# EasyEDA Pro project 嘉立创工程文件.epro

# Schematic Schematic1
Assembly Variant: Basic; Board Name: Board1; Create Date: 2026-05-23; Page Name: P1; Project Name: 温度检测扩展板; Schematic Name: Schematic1; Update Date: 2026-05-23; Company: 嘉立创EDA; Page Size: A4; Version: V1.0
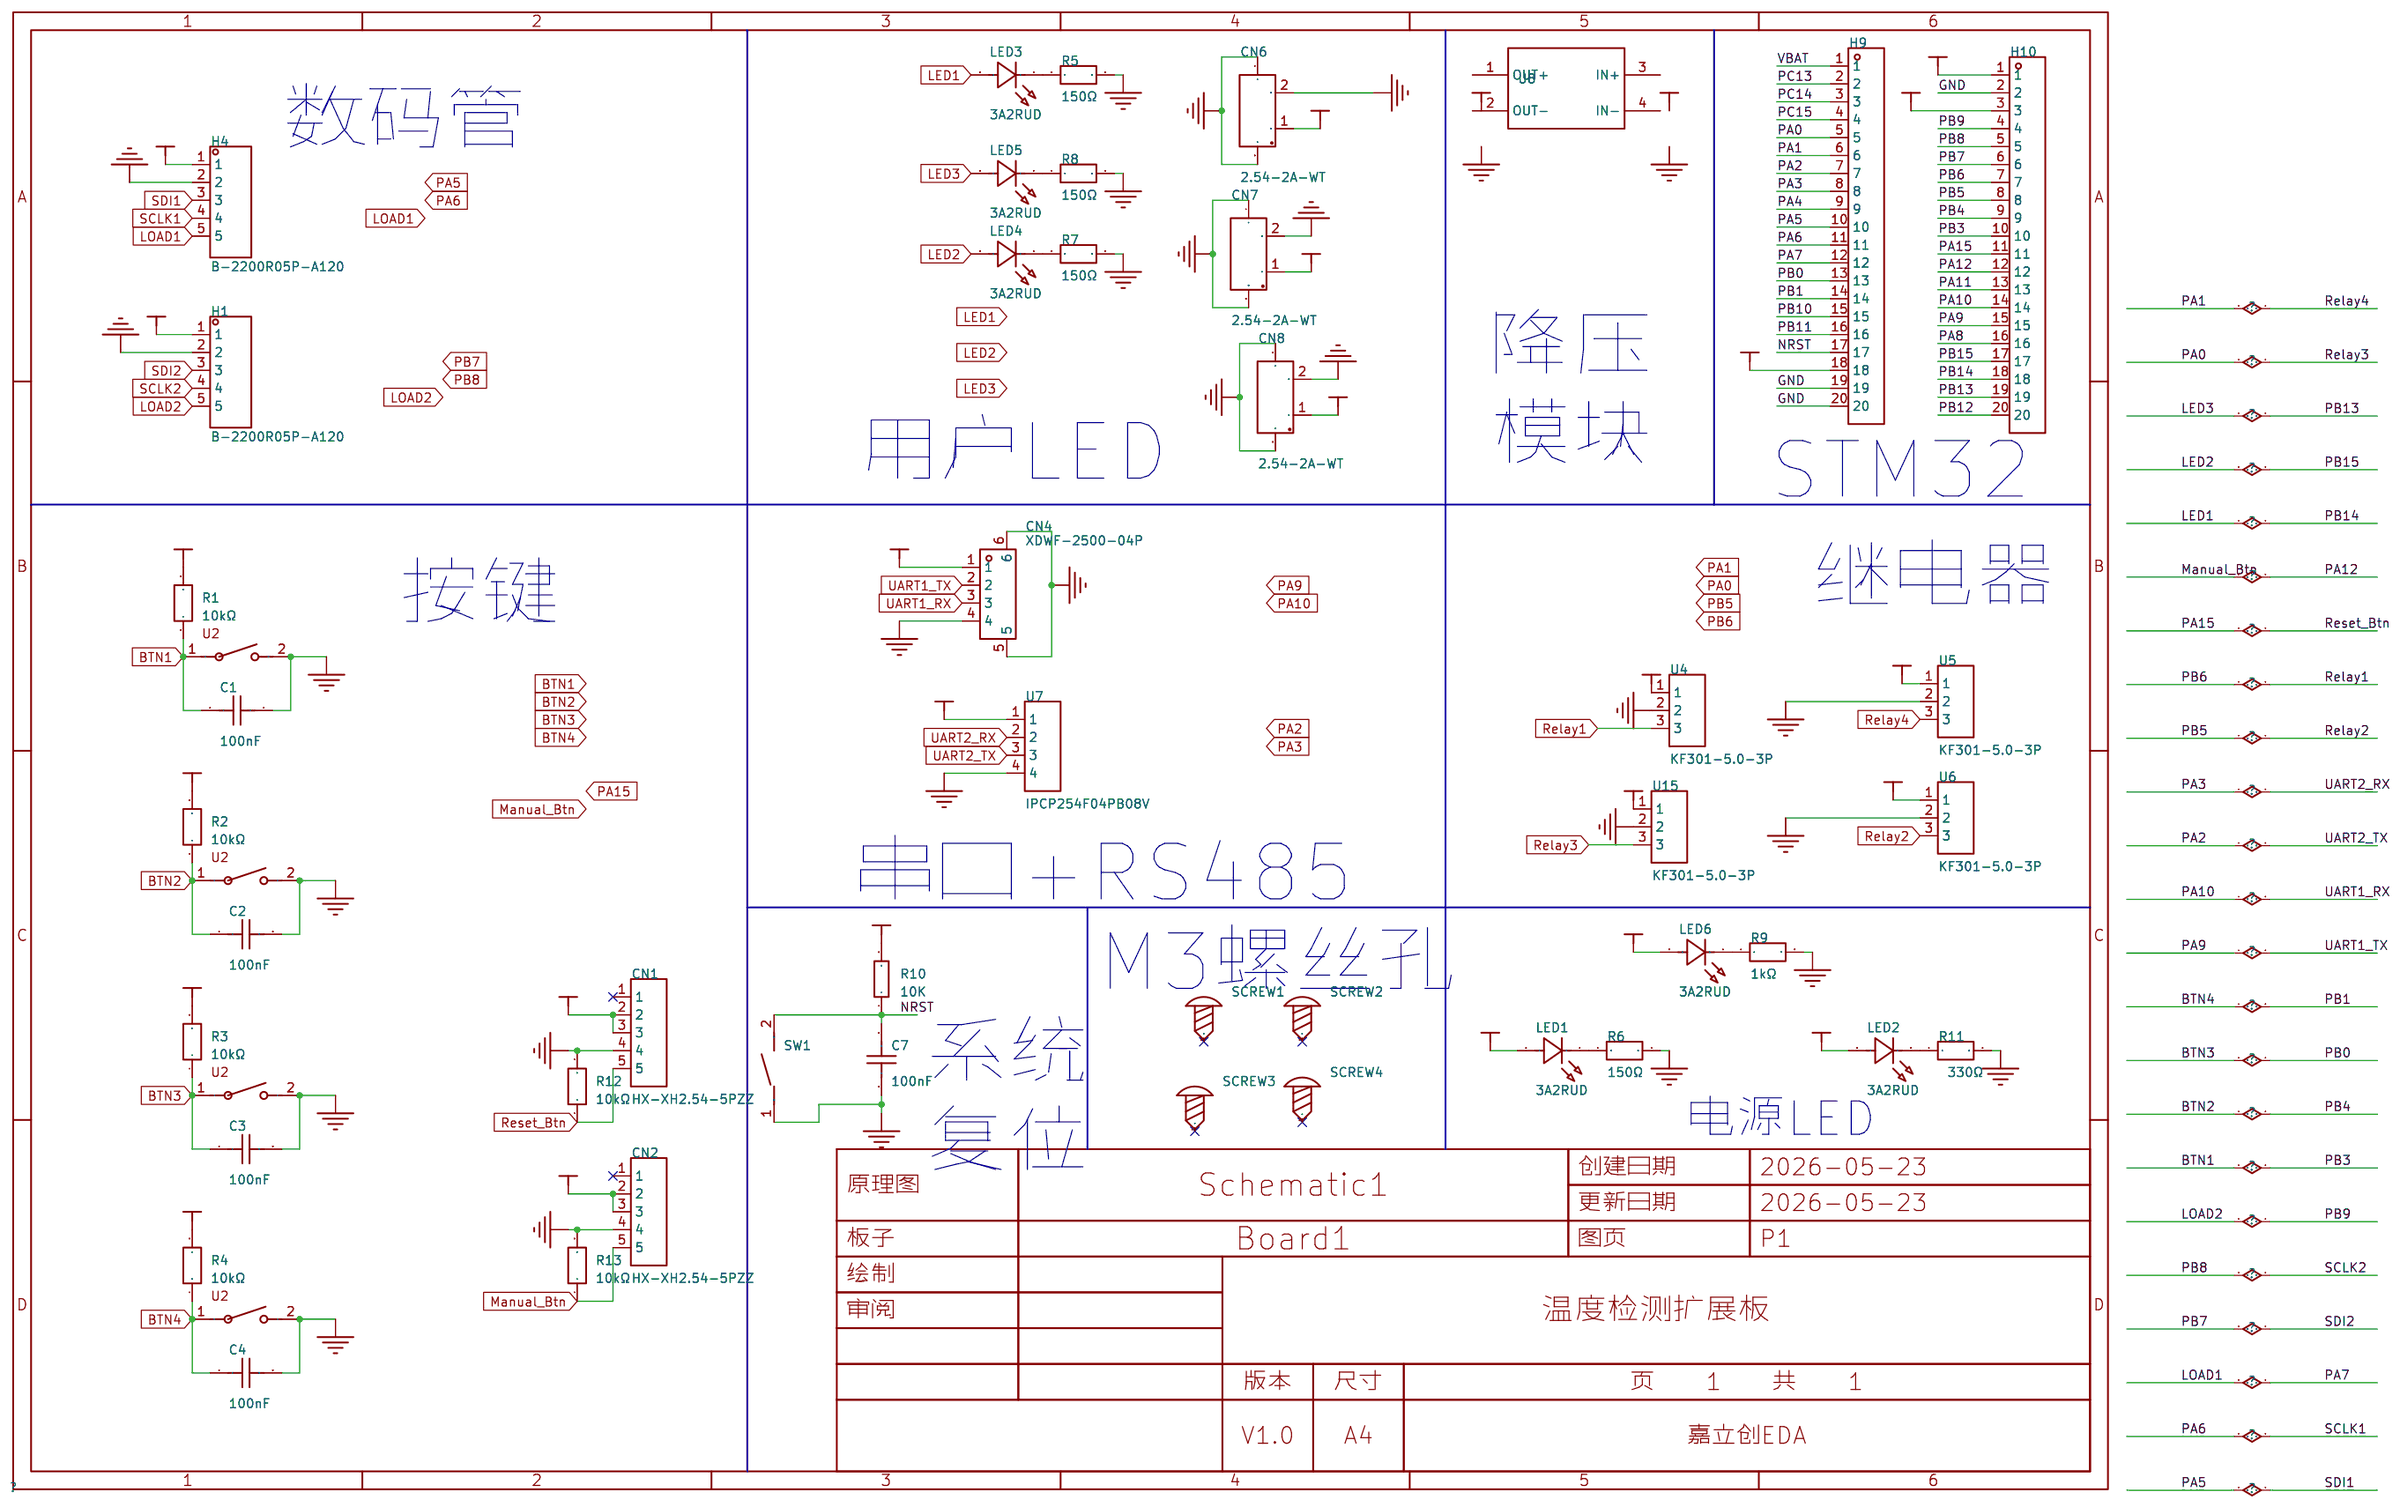
[diagram p0: schematic sheet]

## Parts
C1  100nF  [C0603]
C2  100nF  [C0603]
C3  100nF  [C0603]
C4  100nF  [C0603]
C7  100nF  [C0603]
CN1  HX-XH2.54-5PZZ  [CONN-TH_5P-P2.50_ZX-XH2.54-5PZZ]
CN2  HX-XH2.54-5PZZ  [CONN-TH_5P-P2.50_ZX-XH2.54-5PZZ]
CN4  XDWF-2500-04P  [CONN-SMD_4P-P2.54_MXXH-2.54-04P-WT1-0-A]
CN6  2.54-2A-WT  [CONN-SMD_2.54-2A-WT]
CN7  2.54-2A-WT  [CONN-SMD_2.54-2A-WT]
CN8  2.54-2A-WT  [CONN-SMD_2.54-2A-WT]
H1  B-2200R05P-A120  [HDR-TH_5P-P2.54_220R-1-5P]
H4  B-2200R05P-A120  [HDR-TH_5P-P2.54_220R-1-5P]
H9  22850120ANG1SYA01  [HDR-TH_20P-P2.54-V-F]
H10  22850120ANG1SYA01  [HDR-TH_20P-P2.54-V-F]
LED1  3A2RUD  [LED-TH_BD3.5-P2.28_3A2RUC]
LED2  3A2RUD  [LED-TH_BD3.5-P2.28_3A2RUC]
LED3  3A2RUD  [LED-TH_BD3.5-P2.28_3A2RUC]
LED4  3A2RUD  [LED-TH_BD3.5-P2.28_3A2RUC]
LED5  3A2RUD  [LED-TH_BD3.5-P2.28_3A2RUC]
LED6  3A2RUD  [LED-TH_BD3.5-P2.28_3A2RUC]
R1  10kΩ  [R0603]
R2  10kΩ  [R0603]
R3  10kΩ  [R0603]
R4  10kΩ  [R0603]
R5  150Ω  [R0603]
R6  150Ω  [R0603]
R7  150Ω  [R0603]
R8  150Ω  [R0603]
R9  1kΩ  [R0603]
R10  10K  [R0603]
R11  330Ω  [R0603]
R12  10kΩ  [R0603]
R13  10kΩ  [R0603]
SCREW1  -  [M3螺丝]
SCREW2  -  [M3螺丝]
SCREW3  -  [M3螺丝]
SCREW4  -  [M3螺丝]
SW1  TS-1088-AR02016  [SW-SMD_L3.9-W3.0-P4.45]
U1  -  [大按钮封装]
U2  -  [大按钮封装]
U3  -  [大按钮封装]
U4  KF301-5.0-3P  [CONN-TH_3P-P5.00_KF301-5.0-3P]
U5  KF301-5.0-3P  [CONN-TH_3P-P5.00_KF301-5.0-3P]
U6  KF301-5.0-3P  [CONN-TH_3P-P5.00_KF301-5.0-3P]
U7  IPCP254F04PB08V  [HDR-TH_4P-IPCP254F04PB08V]
U8  -  [降压模块]
U9  -  [大按钮封装]
U15  KF301-5.0-3P  [CONN-TH_3P-P5.00_KF301-5.0-3P]

## Library data of the parts
C1-C4 = CGA0603X7R104K500JT: 容值:100nF;精度:±10%;额定电压:50V;温度系数:X7R;; LCSC Part Name: 100nF ±10% 50V; Supplier Part: C6119867; Manufacturer: HRE(芯声); Supplier Footprint: 0603; JLCPCB Part Class: Extended Part; Datasheet: https://item.szlcsc.com/datasheet/CGA0603X7R104K500JT/7062573.html; Supplier: LCSC; Tolerance: ±10%; Voltage Rating: 50V; Temperature Coefficient: X7R
C7 = CAP_0603: Supplier Footprint: 0603
CN1 CN2 = HX-XH2.54-5PZZ: 插针结构:1x5P;间距:2.54mm;安装方式:直插;参考系列:XH;总PIN数:5P;排数:1;每排PIN数:5;行距:-;额定电流:3A;触头材质:黄铜;触头镀层:锡;工作温度:-25℃~+85℃;; LCSC Part Name: 1x5P 间距:2.5mm 直插 系列:XH; Supplier Part: C42391663; Manufacturer: hanxia(韩下); Supplier Footprint: 插件,P=2.5mm; JLCPCB Part Class: Extended Part; Datasheet: https://item.szlcsc.com/datasheet/HX-XH2.54-5PZZ/44326935.html; Supplier: LCSC; Pins Structure: 1x5P; Pitch: 2.54mm; Mounting Type: 直插; Reference Series: XH; Number of Pins: 5P; Number of Rows: 1; Number of PINs Per Row: 5; Current Rating: 3A; Contact Material: 黄铜; Contact Plating: 锡; Operating Temperature: -25℃~+85℃; Voltage Rating: 250V; Plastic Material: PA66; Flame Retardant Rating: UL94V-0; Color: 白色
CN4 = XDWF-2500-04P: 插针结构:1x4P;间距:2.54mm;安装方式:卧贴;参考系列:XH;总PIN数:4P;排数:1;每排PIN数:4;额定电流:4A;触头材质:黄铜;工作温度:-40℃~+85℃;; LCSC Part Name: 1x4P 间距:2.54mm 卧贴 系列:XH; Supplier Part: C19723931; Manufacturer: LX(连欣科技); Supplier Footprint: SMD,P=2.5mm,卧贴; JLCPCB Part Class: Extended Part; Datasheet: https://item.szlcsc.com/datasheet/XDWF-2500-04P/21042237.html; Supplier: LCSC; Pins Structure: 1x4P; Pitch: 2.54mm; Mounting Type: 卧贴; Reference Series: XH; Number of Pins: 4P; Number of Rows: 1; Number of PINs Per Row: 4; Current Rating: 4A; Contact Material: 黄铜; Operating Temperature: -40℃~+85℃; Voltage Rating: 250V; Plastic Material: LCP; Color: 米色; Z-Height of the Board: 6mm; Y-Width of Bottom Edge on Board: 11.6mm
CN6-CN8 = 2.54-2A-WT: 插针结构:1x2P;间距:2.54mm;安装方式:卧贴;参考系列:XH;总PIN数:2P;排数:1;每排PIN数:2;行距:-;额定电流:500mA;触头镀层:锡;工作温度:-25℃~+85℃;; LCSC Part Name: 1x2P 间距:2.54mm 卧贴 系列:XH; Supplier Part: C722696; Manufacturer: CAX(创都); Supplier Footprint: SMD,P=2.54mm,卧贴; JLCPCB Part Class: Extended Part; Datasheet: https://item.szlcsc.com/datasheet/2.54-2A-WT/766903.html; Supplier: LCSC; Pins Structure: 1x2P; Pitch: 2.54mm; Mounting Type: 卧贴; Reference Series: XH; Number of Pins: 2P; Number of Rows: 1; Number of PINs Per Row: 2; Current Rating: 500mA; Contact Plating: 锡; Operating Temperature: -25℃~+85℃; Voltage Rating: 50V; Plastic Material: LCP; Color: 米色; Z-Height of the Board: 6.1mm; Y-Width of Bottom Edge on Board: 7.8mm
H1 H4 = B-2200R05P-A120: 插孔结构:1x5P;间距:2.54mm;行距:-;圆孔/方孔:方孔;安装方式:弯插;排数:单排;总孔位数:5P;额定电流:3A;插孔方向:侧面;塑高:2.5mm;触头材质:黄铜;触头镀层:-;工作温度:-40℃~+105℃;; LCSC Part Name: 黑色 2.54弯排母; Supplier Part: C124405; Manufacturer: Ckmtw(灿科盟); Supplier Footprint: 弯插,P=2.54mm; JLCPCB Part Class: Extended Part; Datasheet: https://item.szlcsc.com/datasheet/B-2200R05P-A120/125680.html; Supplier: LCSC; Holes Structure: 1x5P; Pitch: 2.54mm; Circular Hole / Square Hole: 方孔; Mounting Type: 弯插; Number of Rows: 单排; Number of Positions: 5P; Current Rating: 3A; Holes Direction: 侧面; Insulation Height: 2.5mm; Contact Material: 黄铜; Operating Temperature: -40℃~+105℃
H9 H10 = 22850120ANG1SYA01: 排数:单排;总孔位数:20P;间距:2.54mm;插孔结构:1x20P;行距:-;安装类型:直插;塑高:-;触头材质:黄铜;触头镀层:-;; LCSC Part Name: 间距:2.54mm 1x20P 直插; Supplier Part: C429947; Manufacturer: JILN(锦凌); Supplier Footprint: 插件,P=2.54mm; JLCPCB Part Class: 扩展库; Datasheet: https://atta.szlcsc.com/upload/public/pdf/source/20190920/C429966_F6288D72CB1EF194DAF75E8AC5D57877.pdf; Supplier: LCSC; Number of Rows: 单排; Number of Holes: 20P; Pitch: 2.54mm; Holes Structure: 1x20P; Mounting Type: 直插; Contact Material: 黄铜
LED1-LED6 = 3A2RUD: 灯头类型:3mm圆形灯头;发光颜色:红色;正向压降(Vf):1.8V~2.2V;功率:-;正向电流:20mA;波长:620nm~625nm;二极管配置:独立二极管;透镜颜色:红色透镜;色温:-;发光强度:200mcd~400mcd;发光角度:30°;载带方式:-;工作温度:-40℃~+85℃;; LCSC Part Name: 3mm 红发红短脚; Supplier Part: C52034637; Manufacturer: Guiguang light(桂光光电); Supplier Footprint: 插件,D=3mm; JLCPCB Part Class: Extended Part; Datasheet: https://item.szlcsc.com/datasheet/3A2RUD/54791005.html; Supplier: LCSC; Lamp Holder Type: 3mm圆形灯头; Illumination Color: 红色; Voltage - Forward(Vf): 1.8V~2.2V; Forward Current: 20mA; Wavelength - Dominant: 620nm~625nm; Peak Wavelength: 625nm; Diode Configuration: 独立二极管; Lens Color: 红色透镜; Luminous Intensity: 200mcd~400mcd; Viewing Angle: 30°; Operating Temperature: -40℃~+85℃
R1-R4 R12 R13 = FRC0603J103 TS: 电阻类型:厚膜电阻;阻值:10kΩ;精度:±5%;功率:100mW;工作电压:75V;温度系数:±100ppm/℃;; LCSC Part Name: 10kΩ ±5% 100mW 厚膜电阻; Supplier Part: C2930027; Manufacturer: FOJAN(富捷); Supplier Footprint: 0603; JLCPCB Part Class: Extended Part; Datasheet: https://item.szlcsc.com/datasheet/FRC0603J103%2520TS/3266960.html; Supplier: LCSC; Type: 厚膜电阻; Tolerance: ±5%; Power(Watts): 100mW; Voltage-Supply(Max): 75V; Temperature Coefficient: ±100ppm/℃; Operating Temperature: -55℃~+155℃
R5-R8 = RC0603FR-07150RP: 电阻类型:厚膜电阻;阻值:150Ω;精度:±1%;功率:100mW;温度系数:±150ppm/℃;; LCSC Part Name: 厚膜电阻 150Ω ±1% 100mW; Supplier Part: C859095; Manufacturer: YAGEO(国巨); Supplier Footprint: 0603; JLCPCB Part Class: Extended Part; Datasheet: https://item.szlcsc.com/datasheet/RC0603FR-07150RP/919430.html; Supplier: LCSC; Type: 厚膜电阻; Tolerance: ±1%; Power(Watts): 100mW; Temperature Coefficient: ±150ppm/℃; Operating Temperature: -55℃~+155℃
R9 = HoARG0603-1/10W-1KR-0.1%-TCR25: 电阻类型:陶瓷电阻;阻值:1kΩ;精度:±0.1%;功率:100mW;最大工作电压:75V;温度系数:±25ppm/℃;; LCSC Part Name: 陶瓷电阻 1kΩ ±0.1% 100mW; Supplier Part: C5123612; Manufacturer: Milliohm(毫欧); Supplier Footprint: 0603; JLCPCB Part Class: Extended Part; Datasheet: https://atta.szlcsc.com/upload/public/pdf/source/20220810/6C2B79E0158B8955D0E7C03ADBB11263.pdf; Supplier: LCSC; Type: 陶瓷电阻; Tolerance: ±0.1%; Power(Watts): 100mW; Overload Voltage (Max): 75V; Temperature Coefficient: ±25ppm/℃; Operating Temperature Range: -55℃~+155℃
R10 = Res_0603: Supplier Footprint: 0603
R11 = GR0603F330RT5G00: 电阻类型:厚膜电阻;阻值:330Ω;精度:±1%;功率:100mW;工作电压:75V;温度系数:±100ppm/℃;; LCSC Part Name: 330R ±1%; Supplier Part: C49653542; Manufacturer: GiantOhm(鼎声微电); Supplier Footprint: 0603; JLCPCB Part Class: Extended Part; Datasheet: https://item.szlcsc.com/datasheet/GR0603F330RT5G00/52211128.html; Supplier: LCSC; Type: 厚膜电阻; Tolerance: ±1%; Power(Watts): 100mW; Voltage-Supply(Max): 75V; Temperature Coefficient: ±100ppm/℃; Operating Temperature: -55℃~+155℃
SCREW1-SCREW4 = M3螺丝: Supplier Footprint: 插件
SW1 = TS-1088-AR02016: 电路结构:单刀单掷;按钮形状:圆形按钮;作用力:1.6N;安装方式:立贴;开关长度:4mm;开关宽度:3mm;开关高度:2mm;带支架:不带支架;触点电流:50mA;额定电压:12V;工作寿命:10万次;; LCSC Part Name: 4*3*2mm 立贴 轻触开关; Supplier Part: C720477; Manufacturer: XUNPU(讯普); Supplier Footprint: SMD,4x3mm; JLCPCB Part Class: Basic Part; Datasheet: https://item.szlcsc.com/datasheet/TS-1088-AR02016/763484.html; Supplier: LCSC; Circuit: 单刀单掷; Actuator Style: 圆形按钮; Operating Force: 1.6N; Mounting Type: 立贴; Length: 4mm; Width: 3mm; Switch Height: 2mm; with Bracket: 不带支架; Contact Current: 50mA; Voltage Rating: 12V; Actuator/Cap Color: 黑色; Termination Style: SMD接片; Life: 10万次; Operating Temperature: -30℃~+80℃
U1-U3 U9 = 大按钮
U4-U6 U15 = KF301-5.0-3P: 结构:1x3P;间距:5mm;颜色:蓝色;安装方式:直插;排数:1;每排PIN数:3;额定电流:17A;额定电压:250V;线规 - AWG:14~22;线规 - 平方毫米:1.5;工作温度:-30℃~+120℃;; LCSC Part Name: 1x3P 5mm 直插 排数:1 每排P数:3; Supplier Part: C474882; Manufacturer: KEFA(科发); Supplier Footprint: 插件,P=5mm; JLCPCB Part Class: Extended Part; Datasheet: https://item.szlcsc.com/datasheet/KF301-5.0-3P/481500.html; Supplier: LCSC; Number of Positions or Pins: 1x3P; Pitch: 5mm; Color: 蓝色; Mounting Type: 直插; Number of Pins: 3P; Number of Rows: 1; Number of PINs Per Row: 3; Current Rating: 17A; Voltage Rating (Max): 250V; Wire Gauge - AWG: 14~22; Wire Gauge - mm2: 1.5; Operating Temperature: -30℃~+120℃
U7 = IPCP254F04PB08V: 插孔结构:1x4P;间距:2.54mm;圆孔/方孔:方孔;安装方式:直插;排数:单排;总孔位数:4P;额定电流:3A;额定电压:-;塑高:8.5mm;触头材质:黄铜;触头镀层:金;工作温度:-40℃~+105℃;; LCSC Part Name: 1x4P 间距:2.54mm 直插; Supplier Part: C22438462; Manufacturer: INCP; Supplier Footprint: 插件,P=2.54mm; JLCPCB Part Class: Extended Part; Datasheet: https://item.szlcsc.com/datasheet/IPCP254F04PB08V/24076651.html; Supplier: LCSC; Holes Structure: 1x4P; Pitch: 2.54mm; Circular Hole / Square Hole: 方孔; Mounting Type: 直插; Number of Rows: 单排; Number of Positions: 4P; Current Rating: 3A; Insulation Height: 8.5mm; Contact Material: 黄铜; Contact Plating: 金; Operating Temperature: -40℃~+105℃
U8 = 降压模块

## Nets
+5V: CN7.1 H10.3 LED2.2(A)
+24V: CN6.1 LED6.2(A)
GND: C1.2 C2.2 C3.2 C4.2 C7.1 CN1.4 CN2.4 CN4.4 CN4.5 CN4.6 CN6.2 CN6.3 CN6.4 CN7.2 CN7.3 CN7.4 CN8.2 CN8.3 CN8.4 H1.2 H4.2 H9.19 H9.20 H10.2 R5.2 R6.2 R7.2 R8.2 R9.2 R11.2 R12.2 R13.2 SW1.1 U1.2 U2.2 U3.2 U4.2 U5.2 U6.2 U7.4 U9.2 U15.2
VBAT: H9.1
VCC: CN1.2 CN1.3 CN2.2 CN2.3 CN4.1 CN8.1 H1.1 H4.1 H9.18 H10.1 LED1.2(A) R1.2 R2.2 R3.2 R4.2 R10.2 U4.1 U5.1 U6.1 U7.1 U15.1
BTN1: C1.1 H10.10 R1.1 U1.1
BTN2: C2.1 H10.9 R2.1 U9.1
BTN3: C3.1 H9.13 R3.1 U2.1
BTN4: C4.1 H9.14 R4.1 U3.1
LED1: H10.18 LED3.2(A)
LED2: H10.17 LED4.2(A)
LED3: H10.19 LED5.2(A)
LOAD1: H4.5 H9.12
LOAD2: H1.5 H10.4
Manual_Btn: CN2.5 H10.12 R13.1
NRST: C7.2 H9.17 R10.1 SW1.2
PA0: H9.5 U15.3
PA1: H9.6 U5.3
PA2: H9.7 U7.3
PA3: H9.8 U7.2
PA4: H9.9
PA5: H4.3 H9.10
PA6: H4.4 H9.11
PA8: H10.16
PA9: CN4.2 H10.15
PA10: CN4.3 H10.14
PA11: H10.13
PA15: CN1.5 H10.11 R12.1
PB5: H10.8 U6.3
PB6: H10.7 U4.3
PB7: H1.3 H10.6
PB8: H1.4 H10.5
PB10: H9.15
PB11: H9.16
PB12: H10.20
PC13: H9.2
PC14: H9.3
PC15: H9.4
$1N177: LED2.1(K) R11.1
$1N179: LED1.1(K) R6.1
$1N180: LED3.1(K) R5.1
$1N181: LED4.1(K) R7.1
$1N182: LED5.1(K) R8.1
$1N186: LED6.1(K) R9.1

Not connected (* = marked no-connect by the designer): CN1 1*; CN2 1*; SCREW1 1*; SCREW2 1*; SCREW3 1*; SCREW4 1*; U8 1(OUT+) 2(OUT-) 3(IN+) 4(IN-)

## Notes on the sheet
- 数码管
- 降压
  模块
- 用户LED
- STM32
- 继电器
- 按键
- 串口+RS485
- M3螺丝孔
- 系统
  复位
- 电源LED

# Board PCB1
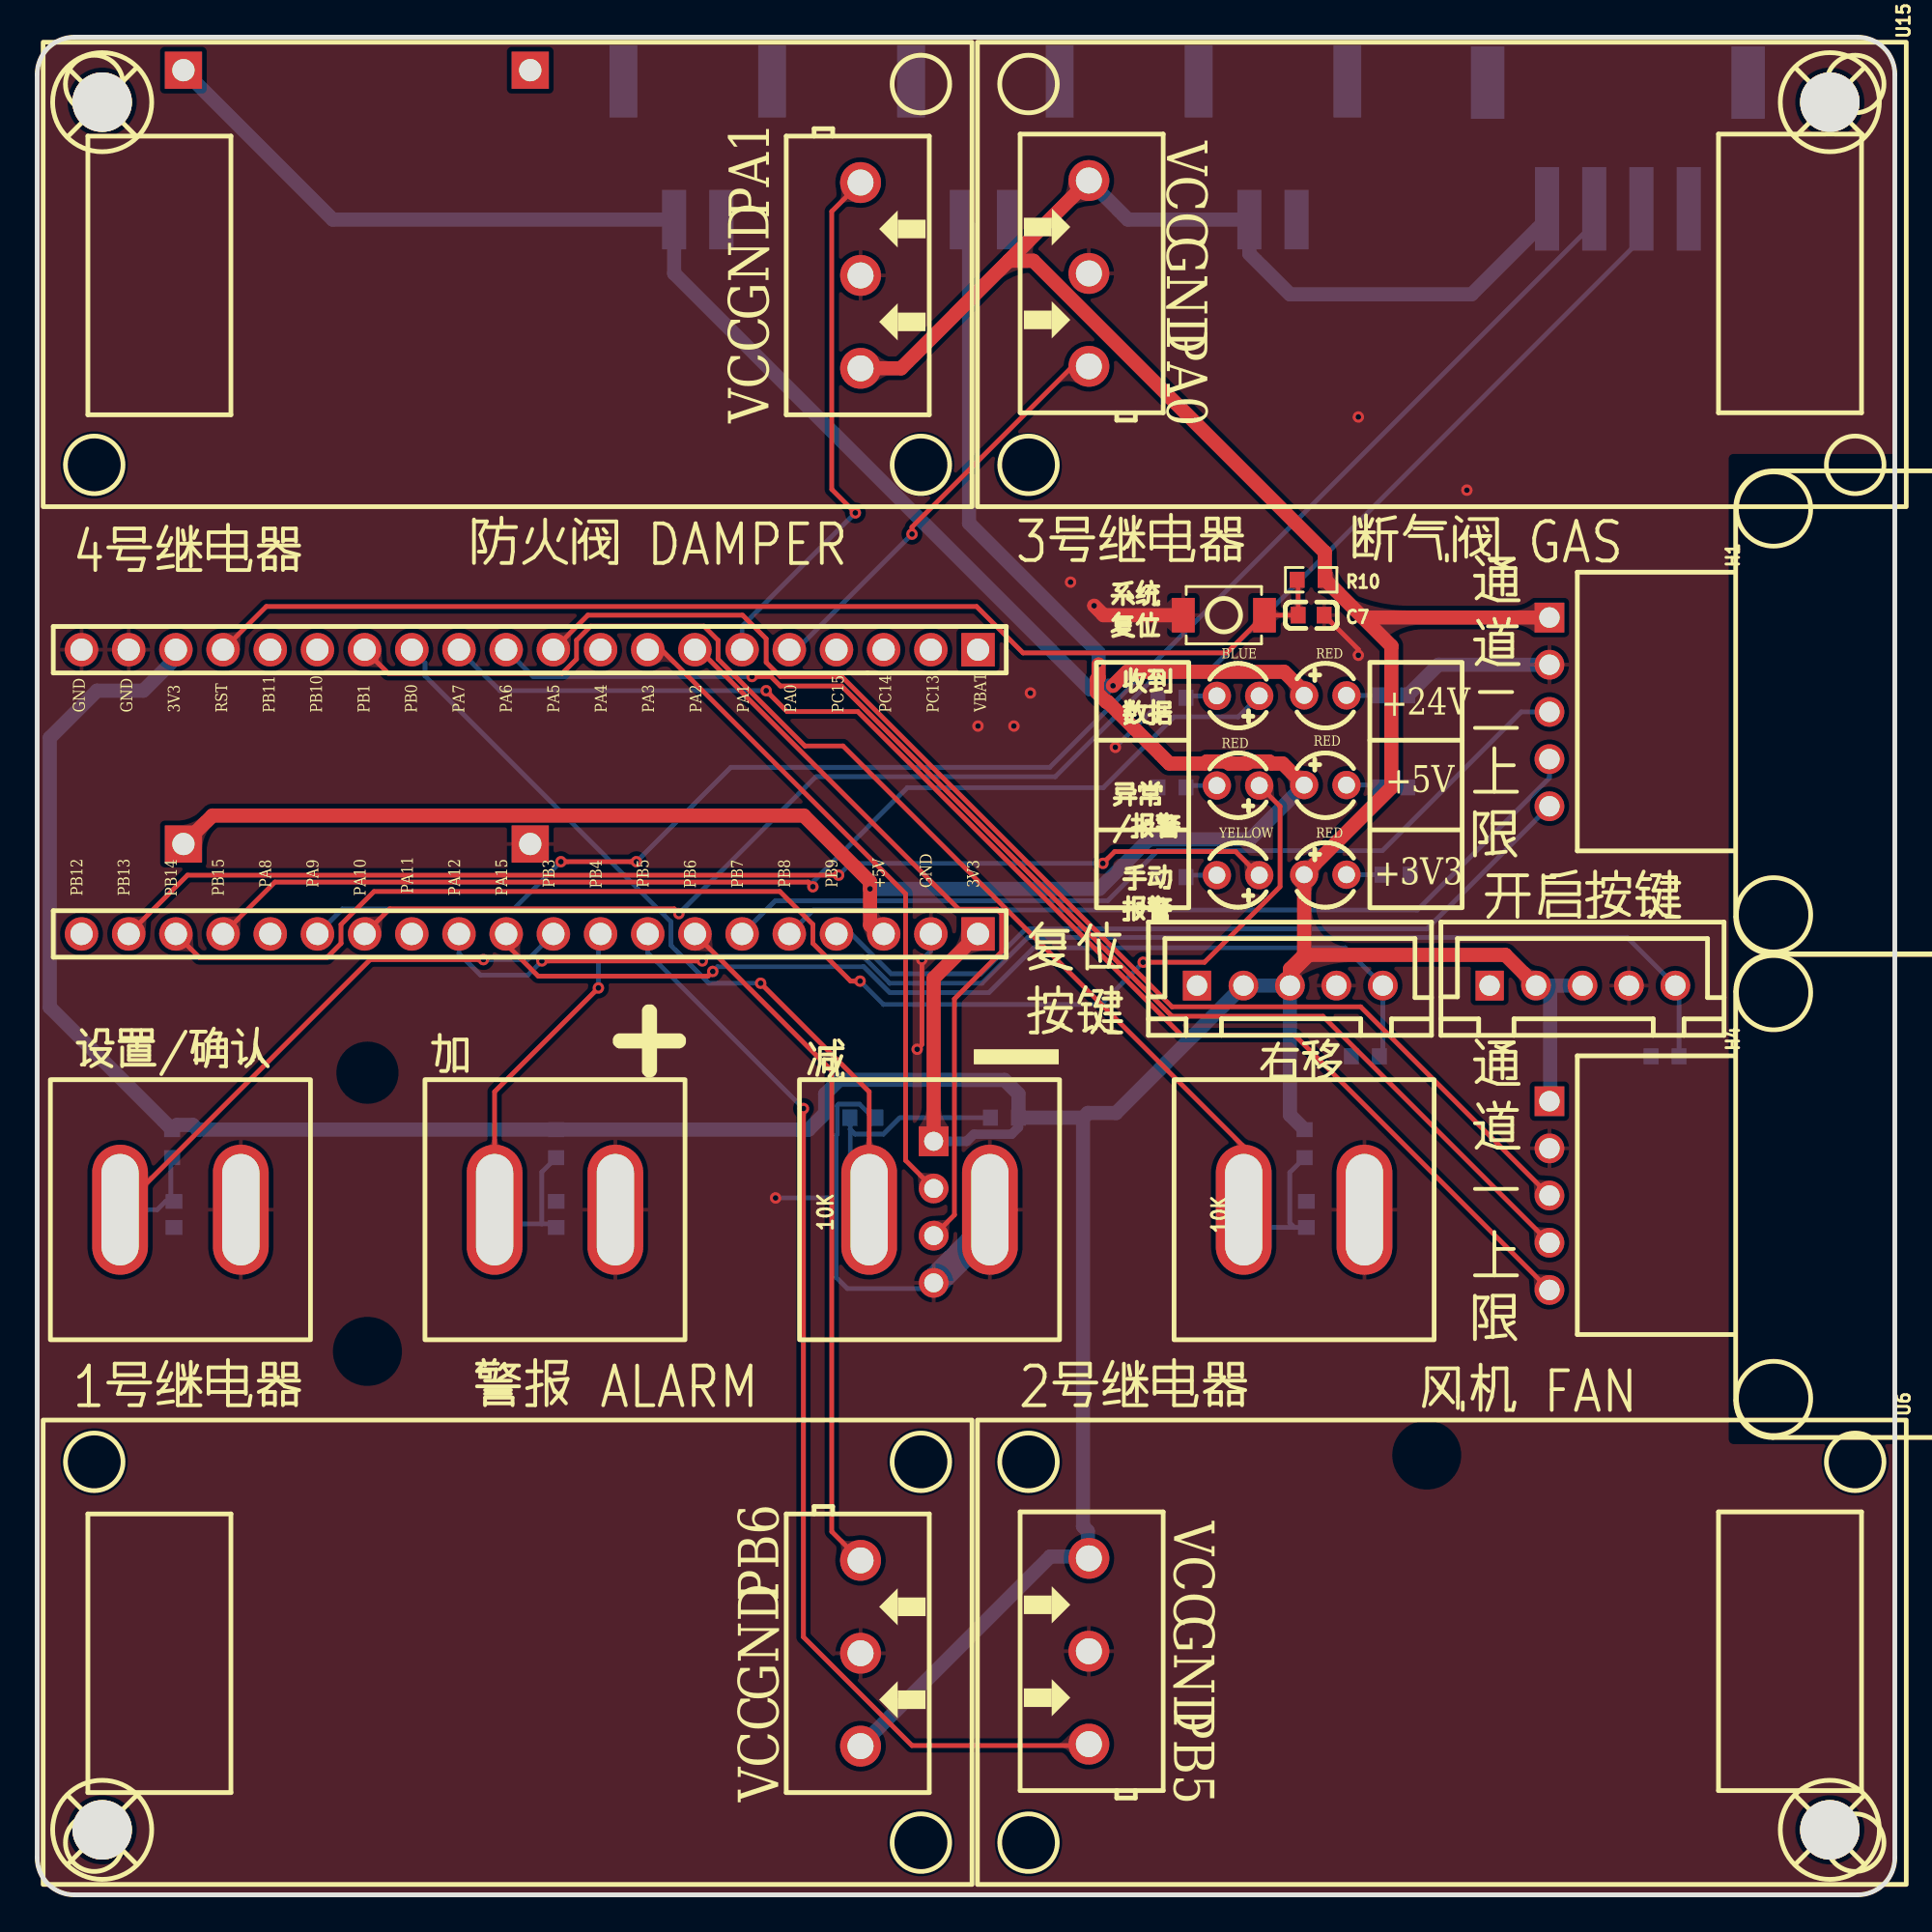
[diagram p1: board, top side]
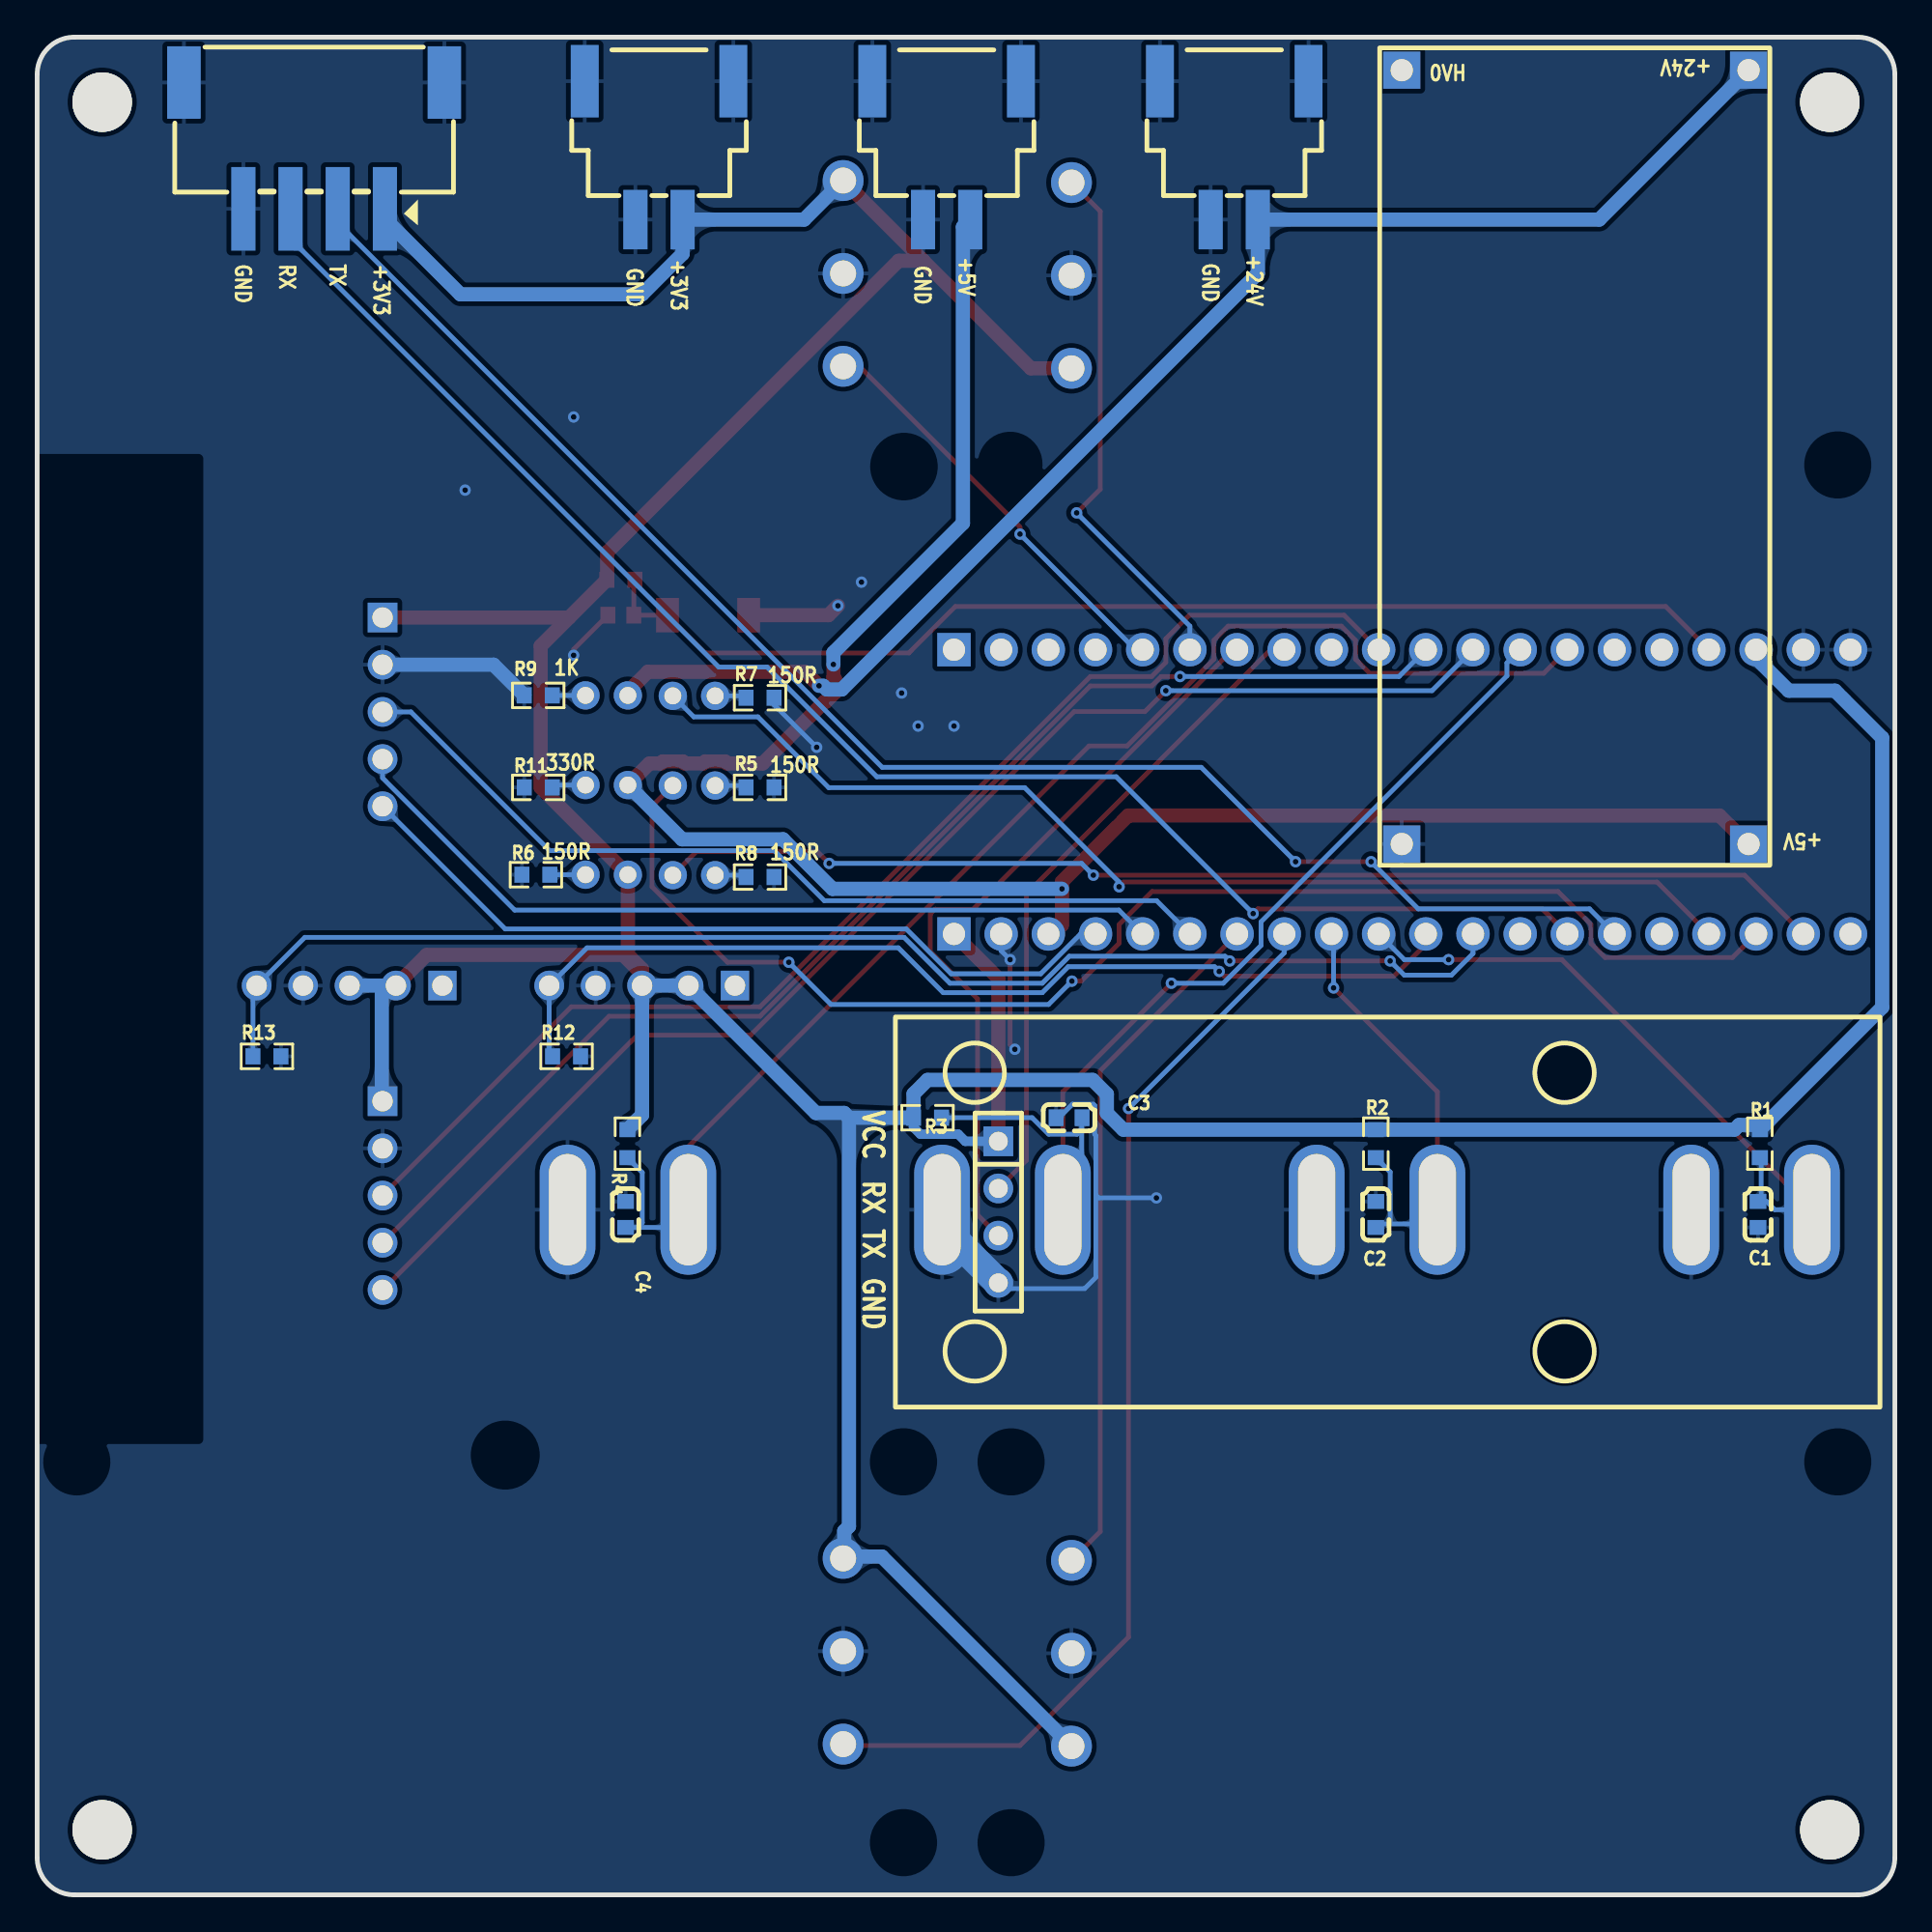
[diagram p2: board, bottom side, seen from below]

Outline 100 x 100 mm; copper layers: Top Layer, Bottom Layer. Coordinates in mm from the lower left corner of the outline.
Outline path: 0,98 0,2 arc(0.59,0.59) 2,0 98,0 arc(99.41,0.59) 100,2 100,98 arc(99.41,99.41) 98,100 2,100 arc(0.59,99.41) 0,98
Stack: Top Layer 0.035mm / Dielectric1 1.51mm FR4 er 4.5 / Bottom Layer 0.035mm

## Design rules (mm)
spacing copperThickness1oz (default): track to track 0.102, other pairs 0 to 0.3
spacing copperThickness2oz: track to track 0.203, other pairs 0.152 to 0.3
track width copperThickness1oz (default): min 0.127, default 0.254, max 2.54
track width copperThickness2oz: min 0.203, default 0.254, max 2.54
differential pair differentialPair (default): width min 0.127, default 0.254, max 2.54; gap min 0.152, default 0.152
net GND uses copperRegion

## Placement (name value [footprint] x y rotation side)
C1  100nF  [C0603]  7.37 36.63 270 bottom
C2  100nF  [C0603]  27.94 36.63 90 bottom
C3  100nF  [C0603]  44.45 41.83 0 bottom
C4  100nF  [C0603]  68.33 36.63 90 bottom
C7  100nF  [C0603]  68.58 68.89 180 top
CN1  HX-XH2.54-5PZZ  [CONN-TH_5P-P2.50_ZX-XH2.54-5PZZ]  67.44 48.95 0 top
CN2  HX-XH2.54-5PZZ  [CONN-TH_5P-P2.50_ZX-XH2.54-5PZZ]  83.19 48.95 0 top
CN4  XDWF-2500-04P  [CONN-SMD_4P-P2.54_MXXH-2.54-04P-WT1-0-A]  85.09 94.16 0 bottom
CN6  2.54-2A-WT  [CONN-SMD_2.54-2A-WT]  35.56 93.9 0 bottom
CN7  2.54-2A-WT  [CONN-SMD_2.54-2A-WT]  51.04 93.9 0 bottom
CN8  2.54-2A-WT  [CONN-SMD_2.54-2A-WT]  66.52 93.9 0 bottom
H1  B-2200R05P-A120  [HDR-TH_5P-P2.54_220R-1-5P]  81.41 63.68 270 top
H4  B-2200R05P-A120  [HDR-TH_5P-P2.54_220R-1-5P]  81.41 37.64 270 top
H9  22850120ANG1SYA01  [HDR-TH_20P-P2.54-V-F]  26.52 67.03 180 top
H10  22850120ANG1SYA01  [HDR-TH_20P-P2.54-V-F]  26.52 51.73 180 top
LED1  3A2RUD  [LED-TH_BD3.5-P2.28_3A2RUC]  69.34 54.92 0 top
LED2  3A2RUD  [LED-TH_BD3.5-P2.28_3A2RUC]  69.34 59.74 0 top
LED3  3A2RUD  [LED-TH_BD3.5-P2.28_3A2RUC]  64.64 59.72 180 top
LED4  3A2RUD  [LED-TH_BD3.5-P2.28_3A2RUC]  64.64 64.54 180 top
LED5  3A2RUD  [LED-TH_BD3.5-P2.28_3A2RUC]  64.64 54.89 180 top
LED6  3A2RUD  [LED-TH_BD3.5-P2.28_3A2RUC]  69.34 64.57 0 top
R1  10kΩ  [R0603]  7.27 40.44 90 bottom
R2  10kΩ  [R0603]  27.94 40.44 90 bottom
R3  10kΩ  [R0603]  52.07 41.83 0 bottom
R4  10kΩ  [R0603]  68.23 40.44 90 bottom
R5  150Ω  [R0603]  61.09 59.61 180 bottom
R6  150Ω  [R0603]  73.15 54.92 0 bottom
R7  150Ω  [R0603]  61.09 64.44 180 bottom
R8  150Ω  [R0603]  61.09 54.79 180 bottom
R9  1kΩ  [R0603]  73.03 64.57 0 bottom
R10  10K  [R0603]  68.58 70.79 0 top
R11  330Ω  [R0603]  73.03 59.61 0 bottom
R12  10kΩ  [R0603]  71.5 45.14 180 bottom
R13  10kΩ  [R0603]  87.63 45.14 180 bottom
SCREW1  -  [M3螺丝]  3.5 96.5 0 top
SCREW2  -  [M3螺丝]  96.5 96.5 0 top
SCREW3  -  [M3螺丝]  3.5 3.5 0 top
SCREW4  -  [M3螺丝]  96.5 3.5 0 top
SW1  TS-1088-AR02016  [SW-SMD_L3.9-W3.0-P4.45]  63.88 68.89 0 top
U1  -  [大按钮封装]  7.71 36.88 0 top
U2  -  [大按钮封装]  48.04 36.88 0 top
U3  -  [大按钮封装]  68.2 36.88 0 top
U4  KF301-5.0-3P  [CONN-TH_3P-P5.00_KF301-5.0-3P]  44.32 13 90 top
U5  KF301-5.0-3P  [CONN-TH_3P-P5.00_KF301-5.0-3P]  44.32 87.17 90 top
U6  KF301-5.0-3P  [CONN-TH_3P-P5.00_KF301-5.0-3P]  56.62 13.11 270 top
U7  IPCP254F04PB08V  [HDR-TH_4P-IPCP254F04PB08V]  48.26 36.75 270 bottom
U8  -  [降压模块]  6.73 55.42 0 bottom
U9  -  [大按钮封装]  27.88 36.88 0 top
U15  KF301-5.0-3P  [CONN-TH_3P-P5.00_KF301-5.0-3P]  56.62 87.28 270 top

## Footprints (pads in the part's own frame, mm; a bottom-side part is the same pattern mirrored in y, then rotated)
C0603
  rect 0.8x0.9 smd: 1(-0.7,0) 2(0.7,0)
CONN-SMD_2.54-2A-WT
  rect 1.3x3.2 smd: 1(-1.27,3.725) 2(1.27,3.725)
  rect 1.5x3.9 smd: 3(-4,-3.725) 4(4,-3.725)
CONN-SMD_4P-P2.54_MXXH-2.54-04P-WT1-0-A
  rect 1.3x4.5 smd: 1(-3.809,3.4) 2(-1.27,3.4) 3(1.27,3.4) 4(3.81,3.4)
  rect 1.8x3.9 smd: 5(7.01,-3.4) 6(-7.01,-3.4)
CONN-TH_3P-P5.00_KF301-5.0-3P
  round 2.2 hole 1.4: 1(-5,0) 2(0,0) 3(5,0)
CONN-TH_5P-P2.50_ZX-XH2.54-5PZZ
  rect 1.524x1.6 hole 1.1: 1(-5,0)
  round 1.6 hole 1.1: 2(-2.5,0) 3(0,0) 4(2.5,0) 5(5,0)
HDR-TH_4P-IPCP254F04PB08V
  rect 1.6x1.6 hole 1.02: 1(-3.81,0)
  round 1.6 hole 1.02: 2(-1.27,0) 3(1.27,0) 4(3.81,0)
HDR-TH_5P-P2.54_220R-1-5P
  rect 1.6x1.6 hole 1.1: 1(-5.08,0)
  round 1.6 hole 1.1: 2(-2.54,0) 3(0,0) 4(2.54,0) 5(5.08,0)
HDR-TH_20P-P2.54-V-F
  rect 1.8x1.8 hole 1.2: 1(-24.13,0)
  round 1.8 hole 1.2: 2(-21.59,0) 3(-19.05,0) 4(-16.51,0) 5(-13.97,0) 6(-11.43,0) 7(-8.89,0) 8(-6.35,0) 9(-3.81,0) 10(-1.27,0) 11(1.27,0) 12(3.81,0) 13(6.35,0) 14(8.89,0) 15(11.43,0) 16(13.97,0) 17(16.51,0) 18(19.05,0) 19(21.59,0) 20(24.13,0)
LED-TH_BD3.5-P2.28_3A2RUC
  round 1.524 hole 0.914: 1(1.14,0) 2(-1.14,0)
M3螺丝
  round 3.2 hole 3.2: 1(0,0)
R0603
  rect 0.806x0.864 smd: 1(-0.753,0) 2(0.753,0)
SW-SMD_L3.9-W3.0-P4.45
  rect 1.23x1.86 smd: 1(-2.185,0) 2(2.185,0)
大按钮封装
  oval 3x7 hole 2x6: 1(-3.25,0) 2(3.25,0)
降压模块
  rect 2x2 hole 1.2: 1(1.143,-1.143) 2(19.812,-1.143) 3(1.143,-42.799) 4(19.812,-42.799)

## Nets
As in the schematic, except:
+5V: CN7.1 H10.3 LED2.2 U8.1
+24V: CN6.1 LED6.2 U8.3
GND: C1.2 C2.2 C3.2 C4.2 C7.1 CN1.4 CN2.4 CN4.4 CN4.5 CN4.6 CN6.2 CN6.3 CN6.4 CN7.2 CN7.3 CN7.4 CN8.2 CN8.3 CN8.4 H1.2 H4.2 H9.19 H9.20 H10.2 R5.2 R6.2 R7.2 R8.2 R9.2 R11.2 R12.2 R13.2 SW1.1 U1.2 U2.2 U3.2 U4.2 U5.2 U6.2 U7.4 U8.2 U9.2 U15.2
Manual_Btn: CN2.5 R13.1

Pads without a net: CN1 1; CN2 1; SCREW1 1; SCREW2 1; SCREW3 1; SCREW4 1

## Via types
v1: diameter 0.61, hole 0.305, Top Layer to Bottom Layer, 34 vias

## Routing (per net, layer and track width the routed paths; a pad name or vN(x,y) marks a point on that pad's centre or on a via; arc(x,y) is an arc through that point)
+5V: length 109.9
  Top Layer w0.762: LED2.2 67.04,60.9 66.43,60.9 66.32,61.01 65.25,61.01 65.13,60.9 64.15,60.9 64.04,61.01 62.97,61.01 62.85,60.9 60.95,60.9 57.63,64.22 57.55,64.22 57.05,64.73 57.05,65.44 57.14,65.53 v1(57.14,66.23) ; H10.3 45.31,51.73 44.83,52.21 v1(44.83,54.15) 44.83,54.53 41.27,58.1 9.44,58.1 U8.1
  Bottom Layer w0.762: v1(44.83,54.15) 57.18,54.15 59.85,56.82 65.28,56.82 LED2.2 ; CN7.1 50.16,89.79 50.16,73.84 57.14,66.86 v1(57.14,66.23)
+24V: length 76.9
  Top Layer w0.762: v1(57.91,65.08) 58.66,65.84 67.12,65.84 68.2,64.76 LED6.2
  Bottom Layer w0.762: v1(57.91,65.08) 57.68,65.08 57.49,64.89 56.69,64.89 34.29,87.28 CN6.1 15.92,90.18 U8.3
GND: length 51.8
  Top Layer w0.254: C7.1 71.12,67.05 v1(71.12,66.73) ; v1(47.37,45.52) 47.62,45.77 v1(47.62,50.34)
  Top Layer w0.762: v1(56.9,69.39) 57.4,68.89 SW1.1
  Bottom Layer w0.254: R7.2 60.33,64.07 v1(58.04,61.77) ; 43.01,37.67 43.01,33.24 43.61,32.64 47.95,32.64 ; 43.01,37.67 42.85,37.52 v1(39.75,37.52) ; 43.01,37.67 43.01,40.88 43.07,40.94 43.07,42.49 43.15,42.56 44.27,42.56 44.99,41.83 C3.2 ; H10.2 48.11,50.83 v1(47.62,50.34)
  Bottom Layer w0.762: H1.2 75.43,66.22 R9.2
  Bottom Layer w1.524: U7.4 51.29,35.97 U2.2
  vias: v1(50.65,62.92) v1(52.58,62.92) v1(53.47,64.69) v1(55.63,70.66) v1(71.12,79.55) v1(76.96,75.62)
VCC: length 296.1
  Top Layer w0.762: H10.1 48.26,49.34 U7.1 ; 71.37,68.76 R10.2 69.31,70.81 69.31,72.27 53.62,87.96 52.3,87.96 ; 71.37,68.76 72.9,67.23 72.9,59.61 LED1.2 68.2,50.6 67.44,49.83 67.44,49.58 ; 71.37,68.76 H1.1 ; CN2.2 79.03,50.6 68.46,50.6 67.44,49.58 ; 67.44,49.58 67.44,48.95 ; 52.3,87.96 46.51,82.17 U5.1 ; 52.3,87.96 U15.1
  Bottom Layer w0.508: R3.2 52.82,41.32 52.45,40.94 50.42,40.94 50.04,40.56 U7.1
  Bottom Layer w0.762: 56.56,18.21 56.56,19.58 56.3,19.83 56.3,41.83 ; 56.56,18.21 U6.1 ; 56.56,18.21 54.53,18.21 U4.1 ; H9.18 7.47,66.57 5.72,64.82 3.22,64.82 0.68,62.28 0.68,47.78 R1.2 7.52,41.44 8.38,41.44 8.64,41.19 R2.2 41.53,41.19 42.42,42.08 42.42,43.1 43.18,43.87 52.07,43.87 52.82,43.11 R3.2 56.3,41.83 ; R4.2 67.44,41.98 CN1.3 CN1.2 58.08,42.09 56.56,42.09 56.3,41.83 ; CN4.1 81.28,90.22 77.22,86.16 67.44,86.16 65.25,88.34 65.25,90.18 58.72,90.18 U15.1 ; H4.1 81.45,42.76 81.45,48.95 ; CN2.2 81.45,48.95 ; 81.45,48.95 CN2.3
BTN1: length 34.9
  Top Layer w0.254: v1(24.02,50.34) 17.92,50.34 U1.1
  Bottom Layer w0.254: 7.19,37.33 C1.1 ; 7.19,37.33 6.91,37.33 6.46,36.88 U1.1 ; 7.19,37.33 7.19,39.61 R1.1 ; v1(24.02,50.34) 26.41,50.34 H10.10
BTN2: length 24.8
  Top Layer w0.254: U9.1 24.62,43.23 v1(30.21,48.82)
  Bottom Layer w0.254: 27.17,36.12 27.17,38.91 R2.1 ; 27.17,36.12 27.75,36.12 27.94,35.93 ; 27.17,36.12 25.39,36.12 U9.1 ; v1(30.21,48.82) 30.21,51.61 H10.9
BTN3: length 55.4
  Top Layer w0.254: v1(38.94,49.07) 44.79,43.23 U2.1
  Bottom Layer w0.254: H9.13 20.88,66.31 20.88,65.61 34.12,52.38 34.12,51.11 36.15,49.07 v1(38.94,49.07) ; U2.1 44.79,38.88 43.77,39.9 43.77,41.2 ; 43.77,41.2 44.03,40.94 45.55,40.94 46.44,41.83 R3.1 ; 43.77,41.2 43.77,41.81 C3.1
BTN4: length 73.1
  Top Layer w0.254: U3.1 64.95,40.27 43.38,61.84 41.33,61.84 36.65,66.52 36.65,67.53 35.89,68.3 29.79,68.3 29.03,67.53 29.03,66.52 28.27,65.76 18.9,65.76 H9.14
  Bottom Layer w0.254: 67.68,35.93 68.33,35.93 ; 67.68,35.93 65.9,35.93 U3.1 ; 67.68,35.93 67.43,36.18 67.43,38.89 R4.1
LED1: length 73.7
  Top Layer w0.254: H10.18 8.74,50.46 15.6,50.46 16.36,51.22 16.36,52.23 18.14,54.01 39.98,54.01 41.76,52.23 41.76,51.22 43.79,49.19 v1(44.3,49.19) ; v1(59.54,50.2) 62.84,50.2 66.9,54.27 66.9,58.59 LED3.2
  Bottom Layer w0.254: v1(59.54,50.2) 57.27,47.93 45.55,47.93 v1(44.3,49.19)
LED2: length 61.4
  Top Layer w0.254: v1(41.76,54.27) 41.5,54.52 12.8,54.52 H10.17
  Bottom Layer w0.254: LED4.2 64.65,63.41 61.2,63.41 57.39,59.6 46.84,59.6 41.76,54.52 v1(41.76,54.27)
LED3: length 63.2
  Top Layer w0.254: v1(43.14,54.89) 8.09,54.89 H10.19 ; v1(57.37,55.52) 58,56.16 64.51,56.16 LED5.2
  Bottom Layer w0.254: v1(43.14,54.89) 43.78,55.52 v1(57.37,55.52)
LOAD1: length 73
  Top Layer w0.254: H4.5 67.69,46.28 61.59,46.28 44.18,63.69 40.37,63.69 v1(39.24,64.82)
  Bottom Layer w0.254: H9.12 24.91,64.82 v1(39.24,64.82)
LOAD2: length 43
  Bottom Layer w0.254: H10.4 43.83,51.73 45.97,49.58 50.8,49.58 53.21,51.99 74.8,51.99 H1.5
MANUAL_BTN: length 74
  Top Layer w0.254: v1(35.81,50.27) v1(27.17,50.27)
  Bottom Layer w0.254: H10.12 22.71,50.67 23.87,49.51 26.41,49.51 v1(27.17,50.27) ; 88.38,45.14 88.38,48.75 85.59,51.54 53.33,51.54 50.86,49.07 45.89,49.07 44.44,50.53 36.06,50.53 v1(35.81,50.27)
NRST: length 62.6
  Top Layer w0.254: H9.17 12.33,69.35 50.57,69.35 53.07,66.85 64.03,66.85 SW1.2 C7.2 67.88,70.74 R10.1
PA0: length 22.7
  Top Layer w0.254: U15.3 56.6,82.27 55.73,82.27 47.09,73.63 v1(47.09,73.25)
  Bottom Layer w0.254: v1(47.09,73.25) 40.87,67.03 H9.5
PA1: length 28.8
  Top Layer w0.254: U5.3 42.77,90.62 42.77,75.66 v1(44.04,74.39)
  Bottom Layer w0.254: v1(44.04,74.39) 37.95,68.3 H9.6
PA2: length 41.2
  Top Layer w0.254: U7.3 49.38,36.6 49.38,48.23 51.92,50.77 51.92,52.8 51.66,53.06 49.61,53.06 35.64,67.03 H9.7
PA3: length 35.8
  Top Layer w0.254: H9.8 33.61,67.03 46.75,53.89 46.75,39.54 U7.2
PA5: length 68.1
  Top Layer w0.254: H4.3 71.25,47.8 61.09,47.8 43.31,65.58 40,65.58 39.24,66.34 39.24,67.61 37.97,68.89 29.65,68.89 H9.10
PA6: length 69.4
  Top Layer w0.254: v1(38.48,65.58) 39.5,65.58 40,65.08 43.31,65.08 61.09,47.3 69.22,47.3 H4.4
  Bottom Layer w0.254: H9.11 26.69,65.58 v1(38.48,65.58)
PA9: length 85.3
  Top Layer w0.254: v1(32.26,55.61) v1(28.19,55.61)
  Bottom Layer w0.254: CN4.2 83.82,90 54.51,60.69 37.34,60.69 v1(32.26,55.61) ; v1(28.19,55.61) 25.65,53.08 16.44,53.08 H10.15
PA10: length 86.1
  Top Layer w0.254: v1(34.54,52.82) 34.29,53.08 18.98,53.08 H10.14
  Bottom Layer w0.254: CN4.3 86.36,89.14 63.31,66.09 60.71,66.09 54.8,60.19 41.91,60.19 v1(34.54,52.82)
PA15: length 55
  Top Layer w0.254: v1(36.37,49.71) 36.12,49.45 26.97,49.45 25.25,51.18 H10.11
  Bottom Layer w0.254: R12.1 72.44,45.32 CN1.5 70.41,50.98 53.64,50.98 51.23,48.56 45.89,48.56 44.5,49.96 36.62,49.96 v1(36.37,49.71)
PB5: length 59.1
  Top Layer w0.254: v1(41.25,42.33) 41.25,13.88 47.09,8.04 56.54,8.04 U6.3
  Bottom Layer w0.254: v1(41.25,42.33) 32.87,50.71 H10.8
PB6: length 37.4
  Top Layer w0.254: U4.3 42.77,19.55 42.77,44.36 H10.7
PB7: length 48.4
  Bottom Layer w0.254: H10.6 39.74,53.52 57.63,53.52 60.32,56.21 72.41,56.21 79.88,63.68 H1.3
PB8: length 45.4
  Bottom Layer w0.254: H10.5 41.77,53.01 74.29,53.01 81.41,60.12 H1.4
$1N177: length 1.8
  Bottom Layer w0.254: LED2.1 72.14,59.74 R11.1
$1N179: length 1.9
  Bottom Layer w0.254: LED1.1 R6.1
$1N180: length 1.7
  Bottom Layer w0.254: LED3.1 61.94,59.72 R5.1
$1N181: length 1.7
  Bottom Layer w0.254: R7.1 61.94,64.54 LED4.1
$1N182: length 1.7
  Bottom Layer w0.254: LED5.1 61.94,54.89 R8.1
$1N186: length 1.8
  Bottom Layer w0.254: LED6.1 R9.1

## Copper pours and planes (outline as drawn; the poured copper is in the pictures)
GND on Top Layer: -9.65,108.76 124.71,108.76 124.71,-11.38 -9.65,-11.38
GND on Bottom Layer: -6.73,104.83 123.19,104.83 123.19,-10.87 -6.73,-10.87

Small or netless copper shapes (teardrops, artwork), in the pictures only: 72 on Top Layer, 113 on Bottom Layer

## Text on the board
Bottom Silkscreen Layer: 0VH | 150R | 1K | 330R | +24V | GND | +5V | +3V3 | TX | RX | VCC
Top Silkscreen Layer: 10K | PB12 | GND | 3V3 | PA0 | RST | PB11 | PB10 | PB1 | PB0 | PA7 | PA6 | PA5 | PA4 | PA3 | PA2 | PA1 | PB13 | PB14 | PB15 | PA8 | PA9 | PA10 | PA11 | PA12 | PA15 | PB3 | PB4 | PB5 | PB6 | PB7 | PB8 | PB9 | PC15 | +5V | PC14 | PC13 | VBAT | YELLOW | BLUE | RED | 系统 / 复位 | 异常 / /报警 | 手动 / 报警 | 收到 / 数据 | +3V3 | +24V | 设置/确认 | 加 | 减 | 右移 | 4号继电器 | 1号继电器 | 防火阀 DAMPER | 警报 ALARM | 3号继电器 | 2号继电器 | 复位 / 按键 | 断气阀 GAS | 风机 FAN | 通 / 道 / 二 / 上 / 限 | 通 / 道 / 一 / 上 / 限 | 开启按键 | VCC
